# Altium project 24V-7A-Power-Board-v2.0.PrjPcb (part 4 of 5)
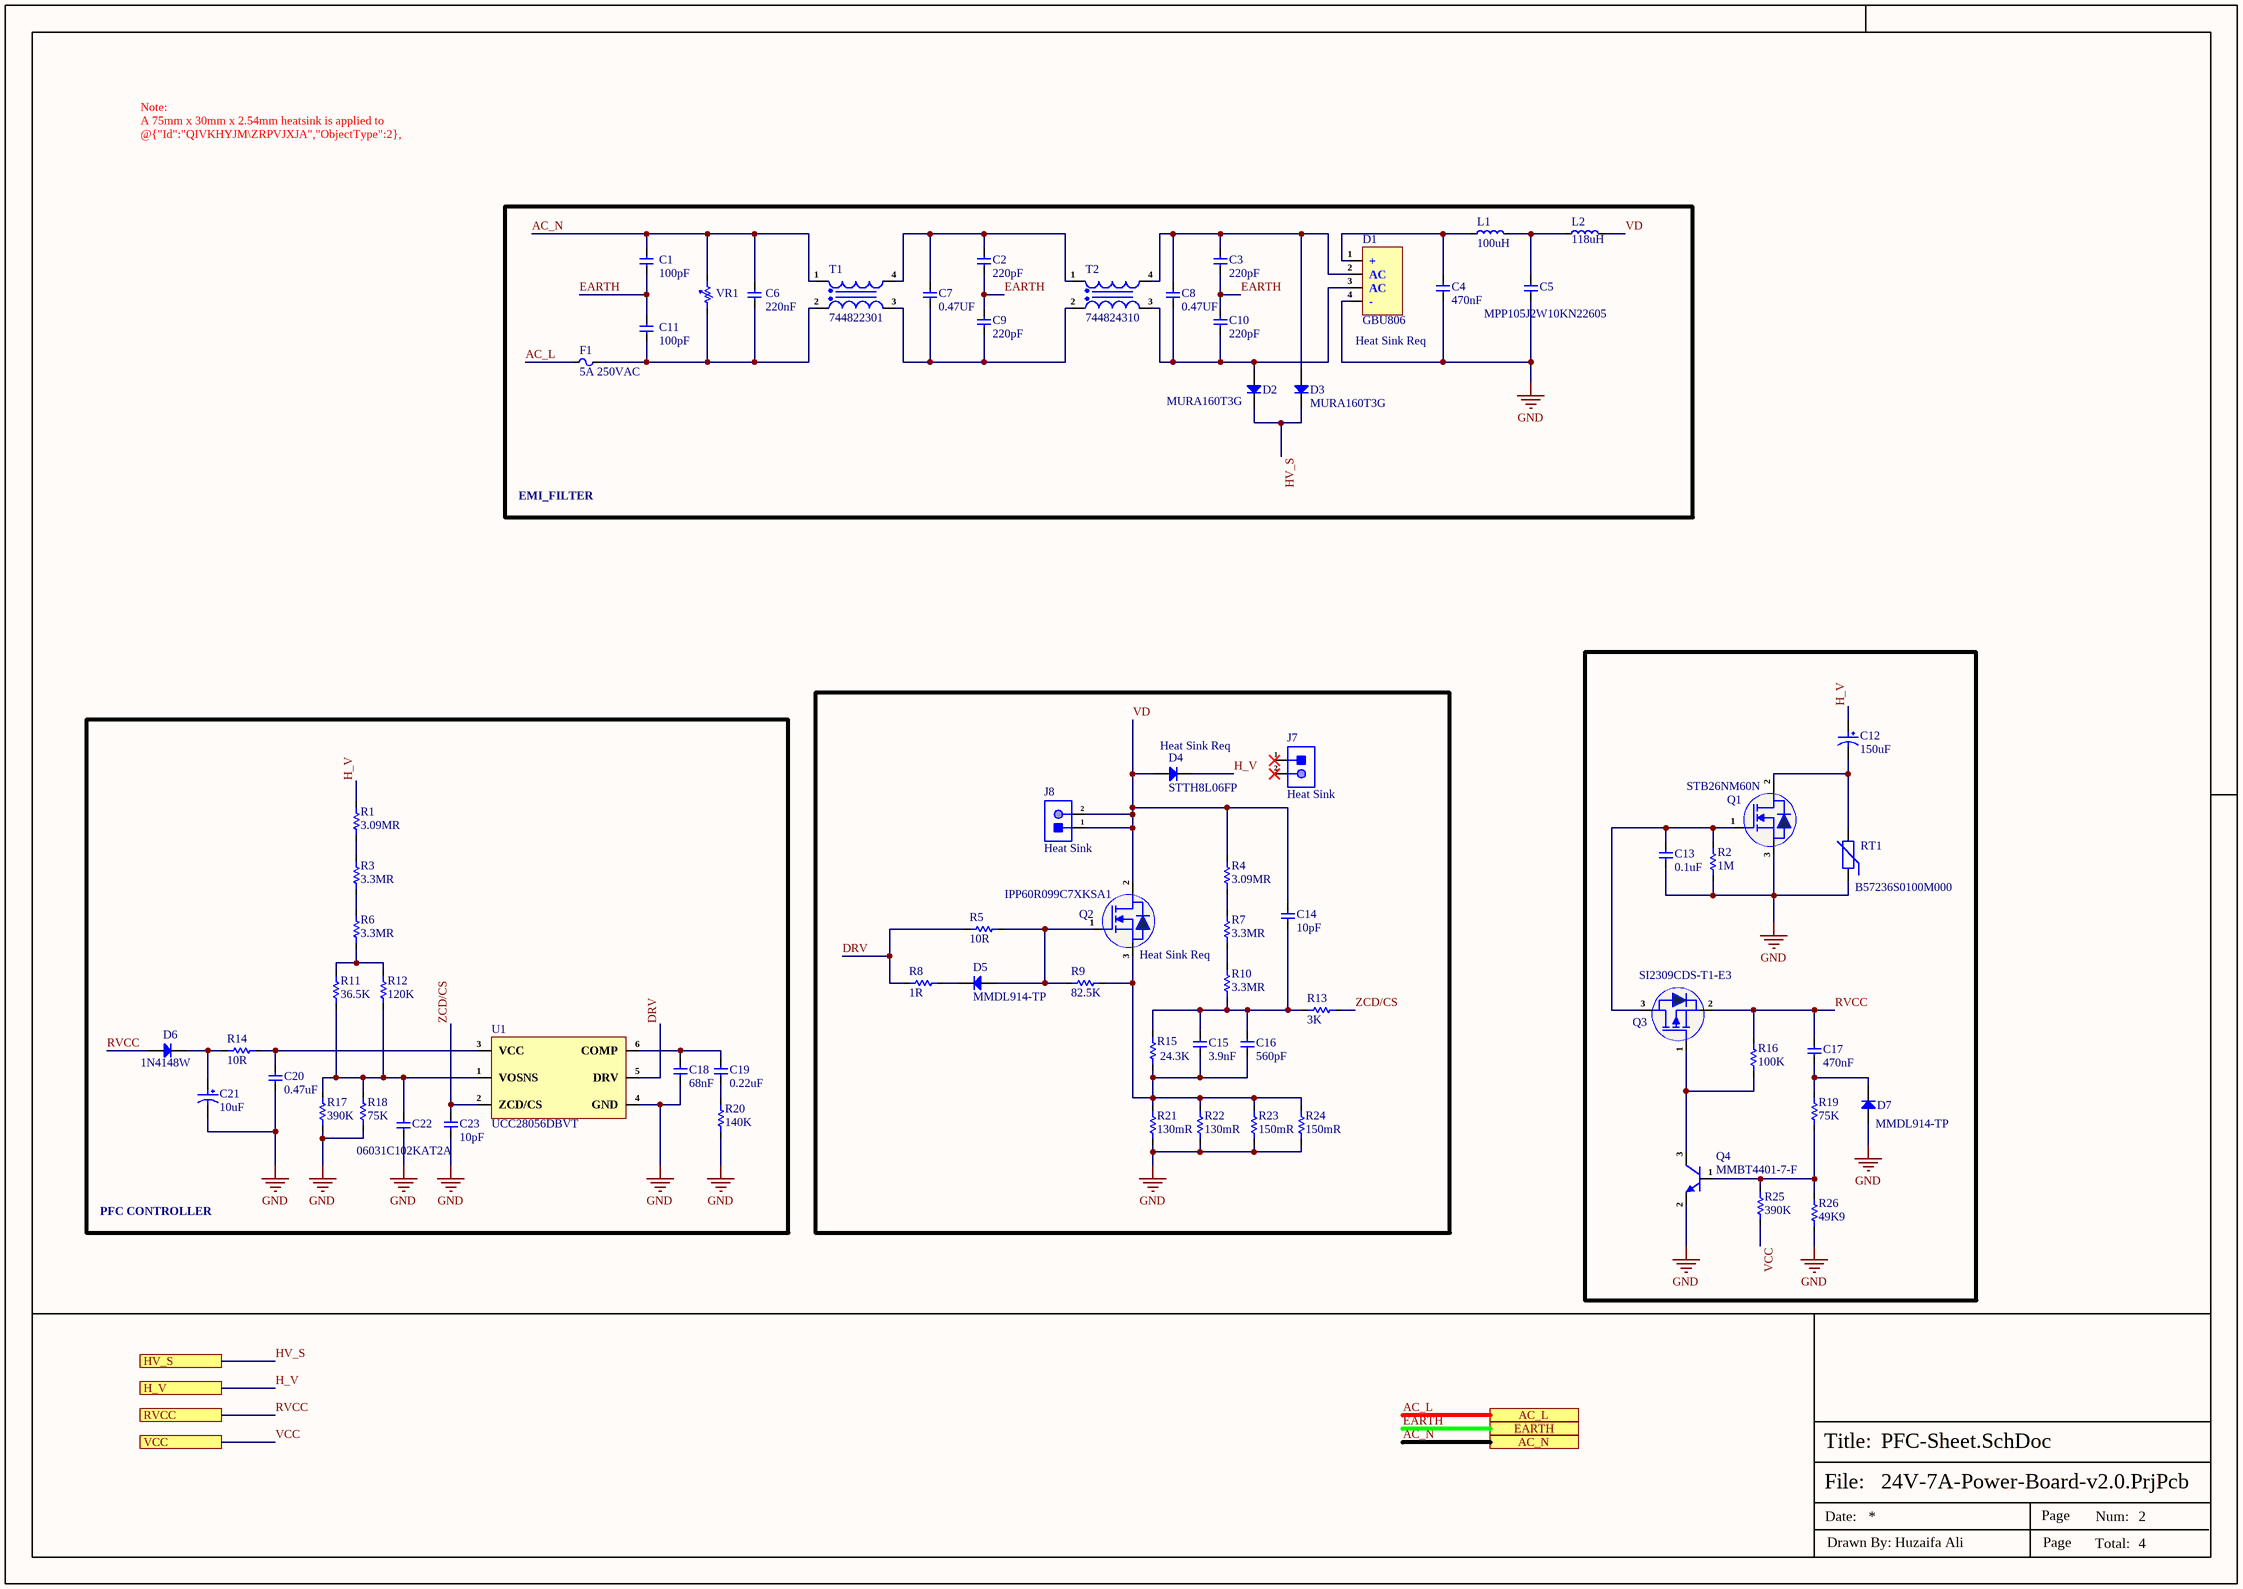
[diagram p6: PFC-Sheet.SchDoc]

## Sheet PFC-Sheet.SchDoc (continued)
### Library data of the parts
C1 C11 = DE1B3RA101KN4AN01F: CAP CER 100PF 250V RADIAL; Manufacturer: Murata; Item Type: Capacitors; Material: 4241ConductorMaterial; Supplier: Mouser; LCSC Part Number: C3285641; Manufacturer Part Number: DE1B3RA101KN4AN01F; RoHS: Yes; Stock: 583; Pricing: 1=0.3, 10=0.147, 50=0.147, 100=0.123, 1000=0.089, 10000=0.061 (USD); Height: 9mm; ComponentLink1URL: https://search.murata.co.jp/Ceramy/image/img/A01X/G101/ENG/DE1_RA_N01F_E.pdf?src-supplier=Digikey; ComponentLink1Description: https://search.murata.co.jp/Ceramy/image/img/A01X/G101/ENG/DE1_RA_N01F_E.pdf?src-supplier=Digikey
C2 C3 C9 C10 = DE1B3RA221KN4AN01F: CAP CER 220PF 250V RADIAL; Manufacturer: Murata; Item Type: Suppression Capacitor; Supplier: Mouser; LCSC Part Number: C1622503; Manufacturer Part Number: DE1B3RA221KN4AN01F; RoHS: Yes; Stock: 985; Pricing: 1=0.35, 10=0.168, 50=0.168, 100=0.141, 1000=0.107, 10000=0.069 (USD); ComponentLink1URL: https://search.murata.co.jp/Ceramy/image/img/A01X/G101/ENG/DE1_RA_N01F_E.pdf?src-supplier=Digikey; ComponentLink1Description: https://search.murata.co.jp/Ceramy/image/img/A01X/G101/ENG/DE1_RA_N01F_E.pdf?src-supplier=Digikey
C4 = 450MPK474J: CAP FILM 0.47UF 5% 450VDC RADIAL; Manufacturer: Rubycon; Item Type: Film Capacitors; Dielectric Material: Polypropylene; Voltage Rating (DC): 450V; Supplier: Digikey; LCSC Part Number: C2798220; Manufacturer Part Number: 450MPK474J; RoHS: Yes; Stock: 4083; Pricing: 1=0.84, 10=0.605, 100=0.4311, 4000=0.26942, 8000=0.25962, 12000=0.25531 (USD); Mounting Technology: Through Hole; Case/Package: Radial; Min Operating Temperature: -40°C; Max Operating Temperature: 105°C; Package Quantity: 1; Value: 470nF; Tolerance: 5%; Packaging: Cut Tape; Termination: PC Pins; Series: MPK; Length: 0.709inch; Width: 0.256inch; Height - Seated (Max): 0.433inch; Lead Pitch: 0.591inch; RoHS Compliant: Yes; ComponentLink1URL: https://datasheet.ciiva.com/6281/e-mpk-6281321.pdf?src-supplier=Digikey; ComponentLink1Description: https://datasheet.ciiva.com/6281/e-mpk-6281321.pdf?src-supplier=Digikey; ComponentLink2URL: https://datasheet.ciiva.com/15021/e-mpk-15021932.pdf?src-supplier=Digikey; ComponentLink2Description: https://datasheet.ciiva.com/15021/e-mpk-15021932.pdf?src-supplier=Digikey
C5 = MPP105J2W10KN22605: 1uF -40℃~+105℃ ±5% 450V Plugin,P=10mm Polypropylene Film Capacitors (CBB) ROHS; Manufacturer: KNSCHA; Supplier: LCSC; LCSC Part Number: C2686214; Manufacturer Part Number: MPP105J2W10KN22605; RoHS: No; Item Type: Capacitor
C6 = X2P2224KN1B0130150080ES0: 220nF ±10% X2 275V Plugin,P=10mm Suppression Capacitors ROHS; Manufacturer: STE; Manufacturer Part Number: X2P2224KN1B0130150080ES0; Package: Plugin,P=10mm; LCSC Part Number: C286022; Item Type: Suppression Capacitor; ComponentLink1Description: LCSC; ComponentLink1URL: https://www.lcsc.com/product-detail/Suppression-Capacitors_STE-Songtian-Elec-X2P2224KN1B0130150080ES0_C286022.html
C7 C8 = 890324024005: CAP FILM 0.47UF 10% 275VAC RAD; Manufacturer: Wurth Electronics; Item Type: Capacitor; Supplier: Digikey; Supplier Part Number: 732-5890-ND; Manufacturer Part Number: 890324024005; RoHS: Yes; Stock: 13537; Pricing: 1=0.75, 50=0.645, 100=0.574, 250=0.501, 500=0.454, 1000=0.418 (USD); ComponentLink1URL: http://www.farnell.com/datasheets/1867975.pdf?src-supplier=Farnell; ComponentLink1Description: http://www.farnell.com/datasheets/1867975.pdf?src-supplier=Farnell; ComponentLink2URL: http://www.farnell.com/datasheets/1867975.pdf?src-supplier=Element14; ComponentLink2Description: http://www.farnell.com/datasheets/1867975.pdf?src-supplier=Element14; ComponentLink3URL: https://katalog.we-online.de/pbs/datasheet/890324024005.pdf?src-supplier=Digikey; ComponentLink3Description: https://katalog.we-online.de/pbs/datasheet/890324024005.pdf?src-supplier=Digikey; ComponentLink4URL: http://www.farnell.com/datasheets/1867975.pdf?src-supplier=Newark; ComponentLink4Description: http://www.farnell.com/datasheets/1867975.pdf?src-supplier=Newark
C12 = KN151M45025*30A: 20% 900mA@120Hz 10mm 450V 150uF Plugin,D25xL30mm Horn-Type Electrolytic Capacitors ROHS; Manufacturer: KFSON; Manufacturer Part Number: KN151M45025*30A; Package: Plugin,D25xL30mm; LCSC Part Number: C513373; Item Type: Capacitor; ComponentLink1Description: LCSC; ComponentLink1URL: https://www.lcsc.com/product-detail/Horn-Type-Electrolytic-Capacitors_KFSON-KN151M45025-30A_C513373.html
C13 = CL10B104KB8WPNC: CAP CER 0.1UF 50V X7R 0603; Item Type: Capacitor; Material: 4241ConductorMaterial; Value: 100nF; Tolerance: 10%; LCSC Part Number: C307348; ComponentLink1Description: LCSC; Supplier: Rs; Supplier Part Number: 2575919; RoHS: Yes; Category: Ceramic Capacitors; Stock: 400; Pricing: 100=0.021, 500=0.019, 1000=0.015, 2000=0.01 (GBP); Mounting Technology: Surface Mount; Case/Package: 0603; Case Code (Metric): 1608; Case Code (Imperial): 0603; Min Operating Temperature: -55°C; Max Operating Temperature: 125°C; Packaging: Cut Tape; Voltage Rating: 50V; Series: CL; Voltage Rating (DC): 50V; Height: 900um; Ratings: AEC-Q200; RoHS Compliant: Yes; Lead Free: 5697LeadFree; ComponentLink2URL: http://www.farnell.com/datasheets/2710560.pdf?src-supplier=Farnell; ComponentLink2Description: http://www.farnell.com/datasheets/2710560.pdf?src-supplier=Farnell; ComponentLink3URL: http://www.samsungsem.com/kr/support/product-search/mlcc/CL10B104KB8WPNC.jsp?src-supplier=Digi-Key; ComponentLink3Description: http://www.samsungsem.com/kr/support/product-search/mlcc/CL10B104KB8WPNC.jsp?src-supplier=Digi-Key; ComponentLink4URL: http://www.farnell.com/datasheets/2710560.pdf?src-supplier=Element14; ComponentLink4Description: http://www.farnell.com/datasheets/2710560.pdf?src-supplier=Element14; ComponentLink5URL: https://datasheet.octopart.com/CL10B104KB8WPNC-Samsung-Electro-Mechanics-datasheet-120093645.pdf?src-supplier=Future+Electronics; ComponentLink5Description: https://datasheet.octopart.com/CL10B104KB8WPNC-Samsung-Electro-Mechanics-datasheet-120093645.pdf?src-supplier=Future+Electronics; ComponentLink6URL: http://www.farnell.com/datasheets/2710560.pdf?src-supplier=Newark; ComponentLink6Description: http://www.farnell.com/datasheets/2710560.pdf?src-supplier=Newark; ComponentLink7URL: http://www.samsungsem.com/servlet/FileDownload?type=spec&file=CL10B104KB8WPNC.pdf&src-supplier=Avnet; ComponentLink7Description: http://www.samsungsem.com/servlet/FileDownload?type=spec&file=CL10B104KB8WPNC.pdf&src-supplier=Avnet; ComponentLink8URL: https://datasheet.octopart.com/CL10B104KB8WPNC-Samsung-datasheet-8326407.pdf?src-supplier=TME; ComponentLink8Description: https://datasheet.octopart.com/CL10B104KB8WPNC-Samsung-datasheet-8326407.pdf?src-supplier=TME
C14 = CC1206JKNPOCBN100: CAP CER 10PF 1KV C0G/NPO 1206; Manufacturer: Yageo; Item Type: Capacitor; Supplier: Future Electronics; LCSC Part Number: C107172; Manufacturer Part Number: CC1206JKNPOCBN100; RoHS: Yes; Stock: 9000; Pricing: 3000=0.0222, 9000=0.0214, 15000=0.021, 60000=0.0201, 90000=0.0194 (USD); ComponentLink1URL: https://datasheet.ciiva.com/11494/hv-11494856.pdf?src-supplier=Avnet; ComponentLink1Description: https://datasheet.ciiva.com/11494/hv-11494856.pdf?src-supplier=Avnet
C15 = CC0603KRX7R8BB392: CAP CER 3900PF 25V X7R 0603; Manufacturer: Yageo; Item Type: Capacitor; Material: 4241ConductorMaterial; Tolerance: 10%; Supplier: Digikey; LCSC Part Number: C519424; Manufacturer Part Number: CC0603KRX7R8BB392; RoHS: Yes; Stock: 46115; Pricing: 1=0.1, 10=0.061, 50=0.035, 100=0.0271, 500=0.02036, 1000=0.016 (USD); Mounting Technology: Surface Mount; Case/Package: 0603; Case Code (Imperial): 0603; Case Code (Metric): 1608; Weight: 7.1E-05oz; Min Operating Temperature: -55°C; Max Operating Temperature: 125°C; Value: 3.9nF; Voltage Rating (DC): 25V; Packaging: Tape and Reel; Dielectric: X7R; Termination: SMD/SMT; Voltage Rating: 25V; Series: CC; Length: 0.063inch; Width: 0.031inch; Height: 900um; Thickness: 0.035inch; Lead Free: Lead Free; Halogen Free: Halogen Free; ComponentLink1URL: https://datasheet.ciiva.com/13207/upy-gphc-x7r-6-3v-to-50v-8-12304-13207771.pdf?src-supplier=Mouser; ComponentLink1Description: https://datasheet.ciiva.com/13207/upy-gphc-x7r-6-3v-to-50v-8-12304-13207771.pdf?src-supplier=Mouser
C16 = 06035A561JAT2A: CAP CER 560PF 50V C0G/NP0 0603; Manufacturer: Kyocera AVX; Item Type: Capacitor; Supplier: Future Electronics; LCSC Part Number: C597173; Manufacturer Part Number: 06035A561JAT2A; RoHS: Yes; Stock: 180000; Pricing: 4000=0.0172, 16000=0.0165, 40000=0.0091, 60000=0.0158, 100000=0.0088, 120000=0.0155, 160000=0.0083, 300000=0.0148 (USD); ComponentLink1URL: https://datasheet.ciiva.com/27051/1032160-27051276.pdf?src-supplier=Jameco; ComponentLink1Description: https://datasheet.ciiva.com/27051/1032160-27051276.pdf?src-supplier=Jameco; ComponentLink2URL: https://datasheet.ciiva.com/16286/ccog-16286446.pdf?src-supplier=Future+Electronics; ComponentLink2Description: https://datasheet.ciiva.com/16286/ccog-16286446.pdf?src-supplier=Future+Electronics; ComponentLink3URL: https://datasheet.ciiva.com/150/ccog-150647.pdf?src-supplier=Digikey; ComponentLink3Description: https://datasheet.ciiva.com/150/ccog-150647.pdf?src-supplier=Digikey; ComponentLink4URL: https://datasheet.ciiva.com/150/ccog-150648.pdf?src-supplier=Digikey; ComponentLink4Description: https://datasheet.ciiva.com/150/ccog-150648.pdf?src-supplier=Digikey; ComponentLink5URL: https://datasheet.ciiva.com/150/ccog-150649.pdf?src-supplier=Digikey; ComponentLink5Description: https://datasheet.ciiva.com/150/ccog-150649.pdf?src-supplier=Digikey; ComponentLink6URL: https://datasheet.ciiva.com/2987/ccog-2987809.pdf?src-supplier=Avnet; ComponentLink6Description: https://datasheet.ciiva.com/2987/ccog-2987809.pdf?src-supplier=Avnet; ComponentLink7URL: https://datasheet.ciiva.com/2987/ccog-2987810.pdf?src-supplier=Avnet; ComponentLink7Description: https://datasheet.ciiva.com/2987/ccog-2987810.pdf?src-supplier=Avnet; ComponentLink8URL: https://datasheet.ciiva.com/5423/ccog-5423589.pdf?src-supplier=Mouser; ComponentLink8Description: https://datasheet.ciiva.com/5423/ccog-5423589.pdf?src-supplier=Mouser; ComponentLink9URL: https://datasheet.ciiva.com/14598/70001039-14598549.pdf?src-supplier=Allied+Electronics; ComponentLink9Description: https://datasheet.ciiva.com/14598/70001039-14598549.pdf?src-supplier=Allied+Electronics; ComponentLink10URL: https://datasheet.ciiva.com/1124/425357-1124836.pdf?src-supplier=Element14; ComponentLink10Description: https://datasheet.ciiva.com/1124/425357-1124836.pdf?src-supplier=Element14; ComponentLink11URL: https://datasheet.ciiva.com/1124/425357-1124837.pdf?src-supplier=Element14; ComponentLink11Description: https://datasheet.ciiva.com/1124/425357-1124837.pdf?src-supplier=Element14
C17 = 12063C474KAT2A: CAP CER 0.47UF 25V X7R 1206; Manufacturer: Kyocera AVX; Item Type: Capacitor; Supplier: Future Electronics; LCSC Part Number: C5128353; Manufacturer Part Number: 12063C474KAT2A; RoHS: Yes; Stock: 38000; Pricing: 2000=0.0614, 6000=0.0591, 10000=0.0566, 20000=0.0567, 40000=0.0554, 80000=0.053 (USD); ComponentLink1URL: https://datasheet.ciiva.com/11788/0900766b80dc2409-11788602.pdf?src-supplier=Rs; ComponentLink1Description: https://datasheet.ciiva.com/11788/0900766b80dc2409-11788602.pdf?src-supplier=Rs; ComponentLink2URL: https://datasheet.ciiva.com/19476/2014158-19476160.pdf?src-supplier=Jameco; ComponentLink2Description: https://datasheet.ciiva.com/19476/2014158-19476160.pdf?src-supplier=Jameco; ComponentLink3URL: https://datasheet.ciiva.com/14601/70001075-14601957.pdf?src-supplier=Allied+Electronics; ComponentLink3Description: https://datasheet.ciiva.com/14601/70001075-14601957.pdf?src-supplier=Allied+Electronics; ComponentLink4URL: https://datasheet.ciiva.com/28546/683218-28546839.pdf?src-supplier=Element14; ComponentLink4Description: https://datasheet.ciiva.com/28546/683218-28546839.pdf?src-supplier=Element14; ComponentLink5URL: https://datasheet.ciiva.com/7833/84526-7833365.pdf?src-supplier=Element14; ComponentLink5Description: https://datasheet.ciiva.com/7833/84526-7833365.pdf?src-supplier=Element14; ComponentLink6URL: https://datasheet.ciiva.com/16291/cx7r-16291039.pdf?src-supplier=Future+Electronics; ComponentLink6Description: https://datasheet.ciiva.com/16291/cx7r-16291039.pdf?src-supplier=Future+Electronics; ComponentLink7URL: https://datasheet.ciiva.com/152/cx7r-152592.pdf?src-supplier=Digikey; ComponentLink7Description: https://datasheet.ciiva.com/152/cx7r-152592.pdf?src-supplier=Digikey; ComponentLink8URL: https://datasheet.ciiva.com/152/cx7r-152593.pdf?src-supplier=Digikey; ComponentLink8Description: https://datasheet.ciiva.com/152/cx7r-152593.pdf?src-supplier=Digikey; ComponentLink9URL: https://datasheet.ciiva.com/152/cx7r-152594.pdf?src-supplier=Digikey; ComponentLink9Description: https://datasheet.ciiva.com/152/cx7r-152594.pdf?src-supplier=Digikey
C18 = CC0603KRX7R9BB683: CAP CER 0.068UF 50V X7R 0603; Manufacturer: Yageo; Item Type: Capacitors; Material: 4241ConductorMaterial; Tolerance: 10%; Supplier: Future Electronics; Supplier Part Number: 3015344; Manufacturer Part Number: CC0603KRX7R9BB683; RoHS: Yes; Stock: 52000; Pricing: 4000=0.0058, 16000=0.0055, 60000=0.0052, 160000=0.005, 400000=0.0047 (USD); Mounting Technology: Surface Mount; Case/Package: 0603; Case Code (Imperial): 0603; Case Code (Metric): 1608; Weight: 7.1E-05oz; Min Operating Temperature: -55°C; Max Operating Temperature: 125°C; Value: 68nF; Voltage Rating (DC): 50V; Packaging: Tape and Reel; Voltage Rating: 50V; Dielectric: X7R; Termination: SMD/SMT; Series: CC; Length: 0.063inch; Width: 0.031inch; Thickness: 0.035inch; Lead Free: Lead Free; Halogen Free: Halogen Free; RoHS Compliant: Yes; ComponentLink1URL: http://www.mouser.com/ds/2/447/Yageo_UPY-GP_NP0_16V-to-50V_9-358835.pdf?src-supplier=Mouser; ComponentLink1Description: http://www.mouser.com/ds/2/447/Yageo_UPY-GP_NP0_16V-to-50V_9-358835.pdf?src-supplier=Mouser; ComponentLink2URL: https://datasheet.octopart.com/CC0603KRX7R9BB683-Yageo-datasheet-166511530.pdf?src-supplier=Future+Electronics; ComponentLink2Description: https://datasheet.octopart.com/CC0603KRX7R9BB683-Yageo-datasheet-166511530.pdf?src-supplier=Future+Electronics; ComponentLink3URL: http://www.yageo.com/documents/recent/UPY-GPHC_X7R_6.3V-to-50V_18.pdf?src-supplier=Digikey; ComponentLink3Description: http://www.yageo.com/documents/recent/UPY-GPHC_X7R_6.3V-to-50V_18.pdf?src-supplier=Digikey; ComponentLink4URL: https://www.yageo.com/upload/media/product/productsearch/datasheet/mlcc/UPY-GPHC_X7R_6.3V-to-50V_18.pdf?src-supplier=Digikey; ComponentLink4Description: https://www.yageo.com/upload/media/product/productsearch/datasheet/mlcc/UPY-GPHC_X7R_6.3V-to-50V_18.pdf?src-supplier=Digikey; ComponentLink5URL: https://datasheet.octopart.com/CC0603KRX7R9BB683-Yageo-datasheet-140260305.pdf?src-supplier=Newark; ComponentLink5Description: https://datasheet.octopart.com/CC0603KRX7R9BB683-Yageo-datasheet-140260305.pdf?src-supplier=Newark; ComponentLink6URL: http://www.yageo.com/documents/recent/UPY-GPHC_X7R_6.3V-to-50V_9.pdf?src-supplier=Future+Electronics; ComponentLink6Description: http://www.yageo.com/documents/recent/UPY-GPHC_X7R_6.3V-to-50V_9.pdf?src-supplier=Future+Electronics; LCSC Part Number: C107098
C19 = CC0603KRX7R7BB224: CAP CER 0.22UF 16V X7R 0603; Manufacturer: Yageo; Item Type: Capacitor; Material: 4241ConductorMaterial; Supplier: Digikey; Supplier Part Number: 311-1426-1-ND; Manufacturer Part Number: CC0603KRX7R7BB224; RoHS: Yes; Stock: 45192; Pricing: 1=0.1, 10=0.058, 50=0.0334, 100=0.0258, 500=0.01944, 1000=0.01528 (USD); Voltage Rating (DC): 16V; Lead Free: 5697LeadFree; Halogen Free: 5694HalogenFree; ComponentLink1URL: https://datasheet.ciiva.com/11788/0900766b80d84f1d-11788400.pdf?src-supplier=Rs; ComponentLink1Description: https://datasheet.ciiva.com/11788/0900766b80d84f1d-11788400.pdf?src-supplier=Rs; ComponentLink2URL: https://datasheet.ciiva.com/176/mlccorderingcode-176606.pdf?src-supplier=Digikey; ComponentLink2Description: https://datasheet.ciiva.com/176/mlccorderingcode-176606.pdf?src-supplier=Digikey; ComponentLink3URL: https://datasheet.ciiva.com/176/mlccorderingcode-176607.pdf?src-supplier=Digikey; ComponentLink3Description: https://datasheet.ciiva.com/176/mlccorderingcode-176607.pdf?src-supplier=Digikey; ComponentLink4URL: https://datasheet.ciiva.com/176/mlccorderingcode-176608.pdf?src-supplier=Digikey; ComponentLink4Description: https://datasheet.ciiva.com/176/mlccorderingcode-176608.pdf?src-supplier=Digikey
C20 = CC1206KKX7R9BB474: CAP CER 0.47UF 50V X7R 1206; Manufacturer: Yageo; Item Type: Capacitor; Material: 4241ConductorMaterial; Supplier: Future Electronics; LCSC Part Number: C277483; Manufacturer Part Number: CC1206KKX7R9BB474; RoHS: Yes; Stock: 36000; Pricing: 3000=0.0393, 9000=0.0378, 15000=0.0371, 30000=0.0362, 60000=0.0349 (USD); ComponentLink1URL: https://datasheet.ciiva.com/13210/upy-gp-np0-16v-to-50v-8-13210236.pdf?src-supplier=Mouser; ComponentLink1Description: https://datasheet.ciiva.com/13210/upy-gp-np0-16v-to-50v-8-13210236.pdf?src-supplier=Mouser; ComponentLink2URL: https://datasheet.ciiva.com/181/mlccorderingcode-181013.pdf?src-supplier=Digikey; ComponentLink2Description: https://datasheet.ciiva.com/181/mlccorderingcode-181013.pdf?src-supplier=Digikey; ComponentLink3URL: https://datasheet.ciiva.com/181/mlccorderingcode-181014.pdf?src-supplier=Digikey; ComponentLink3Description: https://datasheet.ciiva.com/181/mlccorderingcode-181014.pdf?src-supplier=Digikey; ComponentLink4URL: https://datasheet.ciiva.com/181/mlccorderingcode-181015.pdf?src-supplier=Digikey; ComponentLink4Description: https://datasheet.ciiva.com/181/mlccorderingcode-181015.pdf?src-supplier=Digikey
C21 = 50SVPF10M: CAP ALUM POLY 10UF 20% 50V SMD; Manufacturer: Panasonic; Material: 4242ConductorMaterial; Item Type: Capacitor; Supplier: Mouser; Supplier Part Number: 667-50SVPF10M; Manufacturer Part Number: 50SVPF10M; RoHS: Yes; Category: Polymer Capacitors; Stock: 29802; Pricing: 1=1.12, 10=0.801, 50=0.801, 100=0.665, 1000=0.555, 10000=0.504 (USD); ComponentLink1URL: https://datasheet.ciiva.com/48542/svpf-eng-ds-48542427.pdf?src-supplier=Distrelec; ComponentLink1Description: https://datasheet.ciiva.com/48542/svpf-eng-ds-48542427.pdf?src-supplier=Distrelec; ComponentLink2URL: https://datasheet.ciiva.com/24216/svpf-os-262415-24216043.pdf?src-supplier=Mouser; ComponentLink2Description: https://datasheet.ciiva.com/24216/svpf-os-262415-24216043.pdf?src-supplier=Mouser; ComponentLink3URL: https://datasheet.ciiva.com/25761/1734360-25761263.pdf?src-supplier=Farnell; ComponentLink3Description: https://datasheet.ciiva.com/25761/1734360-25761263.pdf?src-supplier=Farnell; LCSC Part Number: C2162323
C22 = 06031C102KAT2A: CAP CER 1000PF 100V X7R 0603; Manufacturer: Kyocera AVX; Item Type: Capacitor; Supplier: Avnet; LCSC Part Number: C2167292; Manufacturer Part Number: 06031C102KAT2A; RoHS: Yes; Stock: 656000; Pricing: 4000=0.0086, 8000=0.0084, 16000=0.0082, 24000=0.008, 32000=0.0079 (USD); Lead Free: 5697LeadFree; ComponentLink1URL: https://datasheet.ciiva.com/5422/cx7r-218113-5422905.pdf?src-supplier=Mouser; ComponentLink1Description: https://datasheet.ciiva.com/5422/cx7r-218113-5422905.pdf?src-supplier=Mouser; ComponentLink2URL: https://datasheet.ciiva.com/11499/cx7r-11499669.pdf?src-supplier=Avnet; ComponentLink2Description: https://datasheet.ciiva.com/11499/cx7r-11499669.pdf?src-supplier=Avnet; ComponentLink3URL: https://datasheet.ciiva.com/2987/cx7r-2987733.pdf?src-supplier=Avnet; ComponentLink3Description: https://datasheet.ciiva.com/2987/cx7r-2987733.pdf?src-supplier=Avnet; ComponentLink4URL: https://datasheet.ciiva.com/150/cx7r-150395.pdf?src-supplier=Digikey; ComponentLink4Description: https://datasheet.ciiva.com/150/cx7r-150395.pdf?src-supplier=Digikey; ComponentLink5URL: https://datasheet.ciiva.com/150/cx7r-150396.pdf?src-supplier=Digikey; ComponentLink5Description: https://datasheet.ciiva.com/150/cx7r-150396.pdf?src-supplier=Digikey; ComponentLink6URL: https://datasheet.ciiva.com/150/cx7r-150397.pdf?src-supplier=Digikey; ComponentLink6Description: https://datasheet.ciiva.com/150/cx7r-150397.pdf?src-supplier=Digikey; ComponentLink7URL: https://datasheet.ciiva.com/1124/1679506-1124198.pdf?src-supplier=Element14; ComponentLink7Description: https://datasheet.ciiva.com/1124/1679506-1124198.pdf?src-supplier=Element14; ComponentLink8URL: https://datasheet.ciiva.com/22693/1679506-22693579.pdf?src-supplier=Element14; ComponentLink8Description: https://datasheet.ciiva.com/22693/1679506-22693579.pdf?src-supplier=Element14; ComponentLink9URL: https://datasheet.ciiva.com/7855/1679506-7855033.pdf?src-supplier=Element14; ComponentLink9Description: https://datasheet.ciiva.com/7855/1679506-7855033.pdf?src-supplier=Element14; ComponentLink10URL: https://datasheet.ciiva.com/7855/84526-7855189.pdf?src-supplier=Element14; ComponentLink10Description: https://datasheet.ciiva.com/7855/84526-7855189.pdf?src-supplier=Element14; ComponentLink11URL: https://datasheet.ciiva.com/16289/cx7r-16289400.pdf?src-supplier=Future+Electronics; ComponentLink11Description: https://datasheet.ciiva.com/16289/cx7r-16289400.pdf?src-supplier=Future+Electronics; ComponentLink12URL: https://datasheet.ciiva.com/14594/70001075-14594623.pdf?src-supplier=Allied+Electronics; ComponentLink12Description: https://datasheet.ciiva.com/14594/70001075-14594623.pdf?src-supplier=Allied+Electronics; ComponentLink13URL: https://datasheet.ciiva.com/14600/70001075-14600988.pdf?src-supplier=Allied+Electronics; ComponentLink13Description: https://datasheet.ciiva.com/14600/70001075-14600988.pdf?src-supplier=Allied+Electronics
C23 = 06035A100JAT2A: CAP CER 10PF 50V C0G/NP0 0603; Manufacturer: Kyocera AVX; Manufacturer Part Number: 06035A100JAT2A/4K; Tolerance: 5%; Dielectric: C0G; Temperature Coefficient: 30ppm/°C; Insulation Resistance: 100GR; Item Type: Capacitor; Supplier 1: Digi-Key; Stock 1: 196463; Pricing 1: 1=0.1, 10=0.05, 50=0.0272, 100=0.0222, 500=0.01586, 1000=0.01246 (USD); Mount: Surface Mount; Case/Package: 0603; Number of Pins: 2; Min Operating Temperature: -55°C; Max Operating Temperature: 125°C; Capacitance: 10pF; Packaging: Cut Tape; Voltage Rating (DC): 50V; Voltage: 50V; Length: 1.6mm; Width: 810um; Height: 0.9mm; Depth: 0.81mm; Thickness: 864um; REACH SVHC: No SVHC; Lead Free: Lead Free; Supplier Part Number 1: 478-1163-1-ND; LCSC Part Number: C79547
D1 = GBU806: BRIDGE RECT 1PHASE 600V 8A GBU; Manufacturer: Diodes; Item Type: Diode; Supplier: Future Electronics; LCSC Part Number: C150753; Manufacturer Part Number: GBU806; RoHS: Yes; Stock: 174414; Pricing: 20=0.565, 100=0.54, 500=0.51, 1000=0.5, 3000=0.465 (USD); ComponentLink1URL: https://datasheet.ciiva.com/27052/1540404-27052400.pdf?src-supplier=Jameco; ComponentLink1Description: https://datasheet.ciiva.com/27052/1540404-27052400.pdf?src-supplier=Jameco; ComponentLink2URL: https://datasheet.ciiva.com/16206/ds21227-16206956.pdf?src-supplier=Future+Electronics; ComponentLink2Description: https://datasheet.ciiva.com/16206/ds21227-16206956.pdf?src-supplier=Future+Electronics; ComponentLink3URL: https://datasheet.ciiva.com/15145/getdatasheetpartid-157294-15145339.pdf?src-supplier=Verical; ComponentLink3Description: https://datasheet.ciiva.com/15145/getdatasheetpartid-157294-15145339.pdf?src-supplier=Verical; ComponentLink4URL: https://datasheet.ciiva.com/885/ds21227-885908.pdf?src-supplier=Digikey; ComponentLink4Description: https://datasheet.ciiva.com/885/ds21227-885908.pdf?src-supplier=Digikey; ComponentLink5URL: https://datasheet.ciiva.com/11195/ds21227-11195657.pdf?src-supplier=Avnet; ComponentLink5Description: https://datasheet.ciiva.com/11195/ds21227-11195657.pdf?src-supplier=Avnet
D2 D3 = MURA160T3G: DIODE GEN PURP 600V 1A SMA; Manufacturer: ON Semiconductor; Forward Current: 2A; Max Reverse Current: 5uA; Max Surge Current: 30A; Forward Voltage: 1.25V; Recovery Time: 75ns; Polarity: Standard; Supplier: Future Electronics; LCSC Part Number: C50432; Manufacturer Part Number: MURA160T3G; RoHS: Yes; Item Type: Diode; Stock: 190000; Pricing: 5000=0.109, 10000=0.106, 15000=0.104, 20000=0.103, 25000=0.0996 (USD); Case/Package: SMA; Pins: 2; Min Operating Temperature: -65°C; Max Operating Temperature: 175°C; Package Quantity: 1; Packaging: Tape and Reel; Average Rectified Current: 2A; Reverse Recovery Time: 75ns; Max Repetitive Reverse Voltage (Vrrm): 600V; Peak Non-Repetitive Surge Current: 30A; Max Forward Surge Current (Ifsm): 30A; Voltage Rating (DC): 600V; Current Rating: 2A; Output Current: 1A; Max Reverse Voltage (DC): 600V; Reverse Voltage: 600V; Series: -; Reverse Recovery Time-Max: 75ns; Length: 4.32mm; Width: 2.6mm; Height: 2mm; Radiation Hardening: No; Reach SVHC Compliant: No; Lead Free: Lead Free; Halogen Free: Halogen Free; RoHS Compliant: Yes; ComponentLink1URL: https://datasheet.ciiva.com/8293/mura160t3-d-8293035.pdf?src-supplier=Avnet; ComponentLink1Description: https://datasheet.ciiva.com/8293/mura160t3-d-8293035.pdf?src-supplier=Avnet; ComponentLink2URL: https://datasheet.ciiva.com/27056/2015775-27056224.pdf?src-supplier=Jameco; ComponentLink2Description: https://datasheet.ciiva.com/27056/2015775-27056224.pdf?src-supplier=Jameco; ComponentLink3URL: https://datasheet.ciiva.com/16395/mura160t3-d-16395990.pdf?src-supplier=Future+Electronics; ComponentLink3Description: https://datasheet.ciiva.com/16395/mura160t3-d-16395990.pdf?src-supplier=Future+Electronics
D4 = STTH8L06FP: DIODE GEN PURP 600V 8A TO220FPAC; Manufacturer: STMicroelectronics; Supplier: Mouser; LCSC Part Number: C77956; Manufacturer Part Number: STTH8L06FP; RoHS: Yes; Item Type: Diode; Stock: 2675; Pricing: 1=0.8, 10=0.793, 50=0.793, 100=0.793, 1000=0.673, 10000=0.377 (USD); ComponentLink1URL: https://datasheet.ciiva.com/4455/cd00002721-110256-4455363.pdf?src-supplier=Mouser; ComponentLink1Description: https://datasheet.ciiva.com/4455/cd00002721-110256-4455363.pdf?src-supplier=Mouser; ComponentLink2URL: https://datasheet.ciiva.com/7964/1522573-7964086.pdf?src-supplier=Element14; ComponentLink2Description: https://datasheet.ciiva.com/7964/1522573-7964086.pdf?src-supplier=Element14; ComponentLink3URL: https://datasheet.ciiva.com/917/cd00002721-917751.pdf?src-supplier=Digikey; ComponentLink3Description: https://datasheet.ciiva.com/917/cd00002721-917751.pdf?src-supplier=Digikey; ComponentLink4URL: https://datasheet.ciiva.com/14169/cd00002721-14169005.pdf?src-supplier=Distrelec; ComponentLink4Description: https://datasheet.ciiva.com/14169/cd00002721-14169005.pdf?src-supplier=Distrelec
D5 D7 = MMDL914-TP: 100V 1V@10mA 4ns 200mA SOD-323 Switching Diodes ROHS; Manufacturer: MCC; Item Type: Diode; Supplier: Digikey; LCSC Part Number: C668970; Manufacturer Part Number: MMDL914-TP; RoHS: Yes; Stock: 172971; Pricing: 1=0.15, 10=0.108, 100=0.0585, 500=0.04594, 1000=0.03191 (USD); ComponentLink1URL: https://datasheet.ciiva.com/6367/mmdl914sod-323-6367364.pdf?src-supplier=Digikey; ComponentLink1Description: https://datasheet.ciiva.com/6367/mmdl914sod-323-6367364.pdf?src-supplier=Digikey; ComponentLink2URL: https://datasheet.ciiva.com/24097/mmdl914sod-323-24097719.pdf?src-supplier=Mouser; ComponentLink2Description: https://datasheet.ciiva.com/24097/mmdl914sod-323-24097719.pdf?src-supplier=Mouser; ComponentLink3URL: https://datasheet.ciiva.com/6367/mmdl914sod-323-6367366.pdf?src-supplier=Digikey; ComponentLink3Description: https://datasheet.ciiva.com/6367/mmdl914sod-323-6367366.pdf?src-supplier=Digikey; ComponentLink4URL: https://datasheet.ciiva.com/6367/mmdl914sod-323-6367368.pdf?src-supplier=Digikey; ComponentLink4Description: https://datasheet.ciiva.com/6367/mmdl914sod-323-6367368.pdf?src-supplier=Digikey
D6 = 1N4148W: 100V 400mW Single 1.25V@150mA 8ns 300mA SOD-123 Switching Diode ROHS; Manufacturer: JSMSEMI; ComponentLink1Description: LCSC; ComponentLink1URL: https://www.lcsc.com/product-detail/Switching-Diode_JSMSEMI-1N4148W_C917030.html; Manufacturer Part Number: 1N4148W; Package: SOD-123; LCSC Part Number: C917030; Item Type: Diode
F1 = 37215000001: FUSE BOARD MNT 5A 250VAC RADIAL; Manufacturer: Littelfuse Wickmann; Item Type: Fuses; Supplier: Digikey; LCSC Part Number: C142820; Manufacturer Part Number: 37215000001; RoHS: Yes; Stock: 2122; Pricing: 1=0.96, 5=0.928, 10=0.869, 50=0.7192, 100=0.5993, 250=0.58436, 500=0.49446 (USD); ComponentLink1URL: https://datasheet.ciiva.com/299/littelfuse-fuse-372-299190.pdf?src-supplier=Digikey; ComponentLink1Description: https://datasheet.ciiva.com/299/littelfuse-fuse-372-299190.pdf?src-supplier=Digikey; ComponentLink2URL: https://datasheet.ciiva.com/16298/littelfuse-fuse-372-16298798.pdf?src-supplier=Future+Electronics; ComponentLink2Description: https://datasheet.ciiva.com/16298/littelfuse-fuse-372-16298798.pdf?src-supplier=Future+Electronics
J7 J8 = 35*12*25: 35*12*25MM 6063-T5 aluminum Heat sink/heatsink ROHS; Manufacturer: XSD; Manufacturer Part Number: 35*12*25; LCSC Part Number: C4663; Item Type: Heat sink; ComponentLink1Description: LCSC; ComponentLink1URL: https://www.lcsc.com/product-detail/Heat-sink-heatsink_XSD-35-12-25_C4663.html
L1 = 7447021: FIXED IND 100UH 2A 80 MOHM TH; Manufacturer: Wurth Electronics; Item Type: Inductors; Supplier: Mouser; Supplier Part Number: 710-7447021; Manufacturer Part Number: 7447021; RoHS: Yes; Stock: 1392; Pricing: 1=1.93, 10=1.83, 50=1.71, 100=1.61, 1000=1.46, 10000=1.46 (USD); ComponentLink1URL: https://datasheet.ciiva.com/11796/0900766b804e2e89-11796539.pdf?src-supplier=Rs; ComponentLink1Description: https://datasheet.ciiva.com/11796/0900766b804e2e89-11796539.pdf?src-supplier=Rs; ComponentLink2URL: https://datasheet.ciiva.com/6693/7447021-6693538.pdf?src-supplier=Digikey; ComponentLink2Description: https://datasheet.ciiva.com/6693/7447021-6693538.pdf?src-supplier=Digikey; ComponentLink3URL: https://datasheet.ciiva.com/14101/pk7447021-data-de-14101850.pdf?src-supplier=Distrelec; ComponentLink3Description: https://datasheet.ciiva.com/14101/pk7447021-data-de-14101850.pdf?src-supplier=Distrelec; ComponentLink4URL: https://datasheet.ciiva.com/7695/7447021-7695676.pdf?src-supplier=Element14; ComponentLink4Description: https://datasheet.ciiva.com/7695/7447021-7695676.pdf?src-supplier=Element14; ComponentLink5URL: https://datasheet.ciiva.com/48691/001087627-da-01-ml-we-fi-funkentstoerdrossel-7447021-de-en-48691575.pdf?src-supplier=Conrad; ComponentLink5Description: https://datasheet.ciiva.com/48691/001087627-da-01-ml-we-fi-funkentstoerdrossel-7447021-de-en-48691575.pdf?src-supplier=Conrad
L2 = 760801401: FIXED IND 118UH 13.9A 0.022OHM; Manufacturer: Wurth Electronics; Item Type: Inductors; Supplier: Digikey; Supplier Part Number: 732-760801401-ND; Manufacturer Part Number: 760801401; RoHS: No; Stock: 36; Pricing: 1=18.9, 5=17.01, 10=15.12, 20=14.175, 100=13.2301 (USD)
Q1 = STB26NM60N: MOSFET N-CH 600V 20A D2PAK; Manufacturer: STMicroelectronics; Item Type: MOSFETs; Supplier: Mouser; LCSC Part Number: C2688646; Manufacturer Part Number: STB26NM60N; RoHS: Yes; Stock: 642; Pricing: 1=5.74, 10=3.91, 50=3.91, 100=3.5, 1000=3.49, 10000=3.49 (USD); ComponentLink1URL: https://datasheet.ciiva.com/25625/0900766b810ea17c-25625320.pdf?src-supplier=Rs; ComponentLink1Description: https://datasheet.ciiva.com/25625/0900766b810ea17c-25625320.pdf?src-supplier=Rs; ComponentLink2URL: https://datasheet.ciiva.com/6368/cd00232934-6368742.pdf?src-supplier=Digikey; ComponentLink2Description: https://datasheet.ciiva.com/6368/cd00232934-6368742.pdf?src-supplier=Digikey; ComponentLink3URL: https://datasheet.ciiva.com/6368/cd00232934-6368743.pdf?src-supplier=Digikey; ComponentLink3Description: https://datasheet.ciiva.com/6368/cd00232934-6368743.pdf?src-supplier=Digikey; ComponentLink4URL: https://datasheet.ciiva.com/940/cd00232934-940186.pdf?src-supplier=Digikey; ComponentLink4Description: https://datasheet.ciiva.com/940/cd00232934-940186.pdf?src-supplier=Digikey; ComponentLink5URL: https://datasheet.ciiva.com/16490/cd00232934-16490237.pdf?src-supplier=Future+Electronics; ComponentLink5Description: https://datasheet.ciiva.com/16490/cd00232934-16490237.pdf?src-supplier=Future+Electronics
Q2 = IPP60R099C7XKSA1: MOSFET N-CH 600V 22A TO220-3; Manufacturer: Infineon; Item Type: MOSFETs; Supplier: Mouser; LCSC Part Number: C537192; Manufacturer Part Number: IPP60R099C7XKSA1; RoHS: Yes; Stock: 617; Pricing: 1=5.39, 10=4.84, 50=4.78, 100=4.69, 1000=2.27, 10000=2.27 (USD); ComponentLink1URL: http://www.mouser.com/ds/2/196/Infineon-IPP60R099C7-DS-v02_00-EN-1076845.pdf?src-supplier=Mouser; ComponentLink1Description: http://www.mouser.com/ds/2/196/Infineon-IPP60R099C7-DS-v02_00-EN-1076845.pdf?src-supplier=Mouser; ComponentLink2URL: https://www.infineon.com/dgdl/Infineon-IPP60R099C7-DS-v02_00-EN.pdf?fileId=5546d4624cb7f111014d481216877004&src-supplier=Digikey; ComponentLink2Description: https://www.infineon.com/dgdl/Infineon-IPP60R099C7-DS-v02_00-EN.pdf?fileId=5546d4624cb7f111014d481216877004&src-supplier=Digikey
Q3 = SI2309CDS-T1-E3: MOSFET P-CH 60V 1.6A SOT23-3; Manufacturer: Vishay Siliconix; Item Type: MOSFETs; Rise Time: 35ns; Rds On Max: 345mR; Input Capacitance: 210pF; Continuous Drain Current (ID): 1.2A; Max Power Dissipation: 1.7W; Gate to Source Voltage (Vgs): 20V; Turn-Off Delay Time: 15ns; Turn-On Delay Time: 40ns; Number of Channels: 1; Polarity: P-CHANNEL; Power Dissipation: 1W; Threshold Voltage: -1V; Supplier: Mouser; LCSC Part Number: C553975; Manufacturer Part Number: SI2309CDS-T1-E3; RoHS: Yes; Stock: 57582; Pricing: 1=0.53, 10=0.453, 50=0.453, 100=0.316, 1000=0.2, 10000=0.157 (USD); Mounting Technology: Surface Mount; Case/Package: SOT-23-3; Pins: 3; Weight: 0.050717oz; Min Operating Temperature: -55°C; Max Operating Temperature: 150°C; Packaging: Tape and Reel; Package Quantity: 3000; Drain to Source Voltage (Vdss): 60V; Drain to Source Resistance: 345mR; Fall Time: 35ns; Series: TrenchFET®; Drain-source On Resistance-Max: 345mR; Length: 3.04mm; Width: 1.4mm; Height: 1.02mm; Radiation Hardening: No; Lead Free: Lead Free; RoHS Compliant: Yes; ComponentLink1URL: https://datasheet.ciiva.com/16217/si2309cd-16217597.pdf?src-supplier=Future+Electronics; ComponentLink1Description: https://datasheet.ciiva.com/16217/si2309cd-16217597.pdf?src-supplier=Future+Electronics; ComponentLink2URL: https://datasheet.ciiva.com/29742/si2309cd-29742879.pdf?src-supplier=Digikey; ComponentLink2Description: https://datasheet.ciiva.com/29742/si2309cd-29742879.pdf?src-supplier=Digikey
Q4 = MMBT4401-7-F: TRANS NPN 40V 0.6A SOT23-3; Manufacturer: Diodes; Item Type: BJTs; Supplier: Future Electronics; LCSC Part Number: C151826; Manufacturer Part Number: MMBT4401-7-F; RoHS: Yes; Stock: 1359000; Pricing: 3000=0.0119, 12000=0.0113, 30000=0.011, 75000=0.0107, 120000=0.0102 (USD); ComponentLink1URL: https://datasheet.ciiva.com/15139/getdatasheetpartid-91436-15139165.pdf?src-supplier=Verical; ComponentLink1Description: https://datasheet.ciiva.com/15139/getdatasheetpartid-91436-15139165.pdf?src-supplier=Verical; ComponentLink2URL: https://datasheet.ciiva.com/972/ds30039-972547.pdf?src-supplier=Digikey; ComponentLink2Description: https://datasheet.ciiva.com/972/ds30039-972547.pdf?src-supplier=Digikey; ComponentLink3URL: https://datasheet.ciiva.com/972/ds30039-972548.pdf?src-supplier=Digikey; ComponentLink3Description: https://datasheet.ciiva.com/972/ds30039-972548.pdf?src-supplier=Digikey; ComponentLink4URL: https://datasheet.ciiva.com/972/ds30039-972549.pdf?src-supplier=Digikey; ComponentLink4Description: https://datasheet.ciiva.com/972/ds30039-972549.pdf?src-supplier=Digikey; ComponentLink5URL: https://datasheet.ciiva.com/11201/ds30039-11201820.pdf?src-supplier=Avnet; ComponentLink5Description: https://datasheet.ciiva.com/11201/ds30039-11201820.pdf?src-supplier=Avnet; ComponentLink6URL: https://datasheet.ciiva.com/16199/ds30039-16199054.pdf?src-supplier=Future+Electronics; ComponentLink6Description: https://datasheet.ciiva.com/16199/ds30039-16199054.pdf?src-supplier=Future+Electronics
R1 R4 = RC1206FR-073M09L: RES 3.09M OHM 1% 1/4W 1206; Manufacturer: Yageo; Item Type: Resistor; Temperature Coefficient: 100ppm/°C; Max Power Dissipation: 250mW; Voltage Rating (DC): 200V; Supplier: Mouser; LCSC Part Number: C488771; Manufacturer Part Number: RC1206FR-073M09L; RoHS: Yes; Stock: 10394; Pricing: 1=0.1, 10=0.025, 50=0.025, 100=0.015, 1000=0.013, 10000=0.01 (USD); Case/Package: 1206; Contact Plating: Tin,Matte; Case Code (Metric): 3216; Case Code (Imperial): 1206; Min Operating Temperature: -55°C; Max Operating Temperature: 155°C; Value: 3.09MR; Tolerance: 1%; Package Quantity: 1; Packaging: Cut Tape; Number of Terminations: 2; Features: Moisture Resistant; Series: RC; Length: 0.122inch; Width: 0.063inch; Height: 0.026inch; Lead Free: Lead Free; RoHS Compliant: Yes; ComponentLink1URL: https://datasheet.ciiva.com/2461/pyu-rc1206-51-rohs-l-4-2461290.pdf?src-supplier=Digikey; ComponentLink1Description: https://datasheet.ciiva.com/2461/pyu-rc1206-51-rohs-l-4-2461290.pdf?src-supplier=Digikey; ComponentLink2URL: https://datasheet.ciiva.com/2461/pyu-rc1206-51-rohs-l-4-2461291.pdf?src-supplier=Digikey; ComponentLink2Description: https://datasheet.ciiva.com/2461/pyu-rc1206-51-rohs-l-4-2461291.pdf?src-supplier=Digikey; ComponentLink3URL: https://datasheet.ciiva.com/2461/pyu-rc1206-51-rohs-l-4-2461292.pdf?src-supplier=Digikey; ComponentLink3Description: https://datasheet.ciiva.com/2461/pyu-rc1206-51-rohs-l-4-2461292.pdf?src-supplier=Digikey
R2 = RC0805FR-071ML: RES 1M OHM 1% 1/8W 0805; Manufacturer: Yageo; Value: 1MR; Power Rating: 125mW; Temperature Coefficient: 250ppm/°C; Voltage Rating: 150V; Item Type: Resistor; Supplier: Future Electronics; Supplier Part Number: 7283393; Manufacturer Part Number: RC0805FR-071ML; RoHS: Yes; Category: Chip SMD Resistors; Stock: 2655000; Pricing: 5000=0.0027, 25000=0.0025, 125000=0.0024, 500000=0.0023, 1250000=0.0021 (USD); Case/Package: Molded; Case Code (Metric): 2012; Case Code (Imperial): 0805; Min Operating Temperature: -55°C; Max Operating Temperature: 155°C; Resistor Type: Thick Film; Tolerance: 1%; Packaging: Tape and Reel; Construction: Rectangular; Resistance Tolerance: 1%; Voltage Rating (AC): 150V; Length: 2mm; Depth: 1.25mm; Lead Free: Lead Free; RoHS Compliant: Yes; Reach SVHC Compliant: Unknown; Military Standard: Not; LCSC Part Number: C107700
R3 R6 R7 R10 = RC1206FR-073M3L: RES 3.3M OHM 1% 1/4W 1206; Manufacturer: Yageo; Item Type: Resistor; Voltage Rating (AC): 200V; Supplier: Future Electronics; LCSC Part Number: C137288; Manufacturer Part Number: RC1206FR-073M3L; RoHS: Yes; Stock: 130000; Pricing: 5000=0.0038, 20000=0.0036, 75000=0.0034, 200000=0.0032, 500000=0.003 (USD); ComponentLink1URL: https://datasheet.ciiva.com/11809/0900766b80c6630a-11809505.pdf?src-supplier=Rs; ComponentLink1Description: https://datasheet.ciiva.com/11809/0900766b80c6630a-11809505.pdf?src-supplier=Rs; ComponentLink2URL: https://datasheet.ciiva.com/2511/pyu-rc1206-51-rohs-l-4-2511094.pdf?src-supplier=Digikey; ComponentLink2Description: https://datasheet.ciiva.com/2511/pyu-rc1206-51-rohs-l-4-2511094.pdf?src-supplier=Digikey; ComponentLink3URL: https://datasheet.ciiva.com/2511/pyu-rc1206-51-rohs-l-4-2511095.pdf?src-supplier=Digikey; ComponentLink3Description: https://datasheet.ciiva.com/2511/pyu-rc1206-51-rohs-l-4-2511095.pdf?src-supplier=Digikey; ComponentLink4URL: https://datasheet.ciiva.com/2511/pyu-rc1206-51-rohs-l-4-2511096.pdf?src-supplier=Digikey; ComponentLink4Description: https://datasheet.ciiva.com/2511/pyu-rc1206-51-rohs-l-4-2511096.pdf?src-supplier=Digikey; ComponentLink5URL: https://datasheet.ciiva.com/17420/pyu-rc1206-51-rohs-l-4-17420140.pdf?src-supplier=Future+Electronics; ComponentLink5Description: https://datasheet.ciiva.com/17420/pyu-rc1206-51-rohs-l-4-17420140.pdf?src-supplier=Future+Electronics
R5 = CRCW060310R0FKEA: RES SMD 10 OHM 1% 1/10W 0603; Manufacturer: Vishay; Item Type: Resistors; Power Rating: 100mW; Voltage Rating: 75V; Temperature Coefficient: 100ppm/°C; Supplier: Mouser; LCSC Part Number: C844919; Manufacturer Part Number: CRCW060310R0FKEA; RoHS: Yes; Stock: 648208; Pricing: 1=0.1, 10=0.017, 50=0.017, 100=0.01, 1000=0.008, 10000=0.005 (USD); Case/Package: 0603; Pins: 2; Weight: 7.1E-05oz; Case Code (Metric): 1608; Case Code (Imperial): 0603; Contact Plating: Tin; Min Operating Temperature: -55°C; Max Operating Temperature: 155°C; Value: 10R; Tolerance: 1%; Resistor Type: Thick Film; Packaging: Tape and Reel; Package Quantity: 10; Number of Terminations: 2; Termination: SMD/SMT; Max Power Dissipation: 100mW; Features: Automotive AEC-Q200; Series: CRCW; Resistance Tolerance: 1%; Technology: THICK FILM; Voltage Rating (DC): 75V; Construction: Rectangular; Length: 1.55mm; Width: 0.033inch; Height: 0.45mm; Depth: 0.85mm; RoHS Compliant: Yes; Reach SVHC Compliant: Unknown; Lead Free: 5697LeadFree; Military Standard: Not; ComponentLink1URL: https://datasheet.ciiva.com/11808/0900766b80d98afc-11808660.pdf?src-supplier=Rs; ComponentLink1Description: https://datasheet.ciiva.com/11808/0900766b80d98afc-11808660.pdf?src-supplier=Rs; ComponentLink2URL: https://datasheet.ciiva.com/26316/fld-crcw-e3-data-en-26316582.pdf?src-supplier=Distrelec; ComponentLink2Description: https://datasheet.ciiva.com/26316/fld-crcw-e3-data-en-26316582.pdf?src-supplier=Distrelec; ComponentLink3URL: https://datasheet.ciiva.com/2465/dcrcwe3-2465700.pdf?src-supplier=Digikey; ComponentLink3Description: https://datasheet.ciiva.com/2465/dcrcwe3-2465700.pdf?src-supplier=Digikey; ComponentLink4URL: https://datasheet.ciiva.com/16781/70201119-16781847.pdf?src-supplier=Allied+Electronics; ComponentLink4Description: https://datasheet.ciiva.com/16781/70201119-16781847.pdf?src-supplier=Allied+Electronics; ComponentLink5URL: https://datasheet.ciiva.com/22673/1697337-22673071.pdf?src-supplier=Element14; ComponentLink5Description: https://datasheet.ciiva.com/22673/1697337-22673071.pdf?src-supplier=Element14; ComponentLink6URL: https://datasheet.ciiva.com/2465/dcrcwe3-2465701.pdf?src-supplier=Digikey; ComponentLink6Description: https://datasheet.ciiva.com/2465/dcrcwe3-2465701.pdf?src-supplier=Digikey; ComponentLink7URL: https://datasheet.ciiva.com/2465/dcrcwe3-2465699.pdf?src-supplier=Digikey; ComponentLink7Description: https://datasheet.ciiva.com/2465/dcrcwe3-2465699.pdf?src-supplier=Digikey; ComponentLink8URL: https://datasheet.ciiva.com/5547/dcrcwe3-109170-5547342.pdf?src-supplier=Mouser; ComponentLink8Description: https://datasheet.ciiva.com/5547/dcrcwe3-109170-5547342.pdf?src-supplier=Mouser
R8 = CRCW06031R00FKEA: RES SMD 1 OHM 1% 1/10W 0603; Manufacturer: Vishay Dale; Item Type: Resistor; Power Rating: 100mW; Voltage Rating: 75V; Temperature Coefficient: 100ppm/°C; Supplier: Mouser; LCSC Part Number: C844752; Manufacturer Part Number: CRCW06031R00FKEA; RoHS: Yes; Stock: 303523; Pricing: 1=0.1, 10=0.024, 50=0.024, 100=0.014, 1000=0.011, 10000=0.006 (USD); Case/Package: 0603; Pins: 2; Contact Plating: Tin; Weight: 7.1E-05oz; Case Code (Metric): 1608; Case Code (Imperial): 0603; Min Operating Temperature: -55°C; Max Operating Temperature: 155°C; Value: 1R; Tolerance: 1%; Resistor Type: Thick Film; Termination: SMD/SMT; Voltage Rating (DC): 75V; Packaging: Tape and Reel; Number of Terminations: 2; Max Power Dissipation: 100mW; Features: Automotive AEC-Q200; Series: CRCW; Construction: Rectangular; Resistance Tolerance: 1%; Package Quantity: 5000; Length: 1.55mm; Width: 0.85mm; Height: 0.45mm; Depth: 0.85mm; Ratings: AEC-Q200; Radiation Hardening: No; Lead Free: 5697LeadFree; RoHS Compliant: Yes; Military Standard: Not; Reach SVHC Compliant: Unknown; ComponentLink1URL: https://datasheet.ciiva.com/7792/1359337-7792119.pdf?src-supplier=Element14; ComponentLink1Description: https://datasheet.ciiva.com/7792/1359337-7792119.pdf?src-supplier=Element14; ComponentLink2URL: https://datasheet.ciiva.com/3257/dcrcwe3-3257225.pdf?src-supplier=Avnet; ComponentLink2Description: https://datasheet.ciiva.com/3257/dcrcwe3-3257225.pdf?src-supplier=Avnet; ComponentLink3URL: https://datasheet.ciiva.com/2465/dcrcwe3-2465530.pdf?src-supplier=Digikey; ComponentLink3Description: https://datasheet.ciiva.com/2465/dcrcwe3-2465530.pdf?src-supplier=Digikey; ComponentLink4URL: https://datasheet.ciiva.com/2465/dcrcwe3-2465528.pdf?src-supplier=Digikey; ComponentLink4Description: https://datasheet.ciiva.com/2465/dcrcwe3-2465528.pdf?src-supplier=Digikey; ComponentLink5URL: https://datasheet.ciiva.com/5541/dcrcwe3-109170-5541726.pdf?src-supplier=Mouser; ComponentLink5Description: https://datasheet.ciiva.com/5541/dcrcwe3-109170-5541726.pdf?src-supplier=Mouser
R9 = RC0603FR-0782K5L: RES 82.5K OHM 1% 1/10W 0603; Manufacturer: Yageo; Item Type: Resistor; Voltage Rating (DC): 50V; Supplier: Avnet; LCSC Part Number: C185310; Manufacturer Part Number: RC0603FR-0782K5L; RoHS: Yes; Stock: 165000; Pricing: 5000=0.00112 (USD); Lead Free: 5697LeadFree; ComponentLink1URL: https://datasheet.ciiva.com/2519/pyu-r-int-thick-7-2519111.pdf?src-supplier=Digikey; ComponentLink1Description: https://datasheet.ciiva.com/2519/pyu-r-int-thick-7-2519111.pdf?src-supplier=Digikey; ComponentLink2URL: https://datasheet.ciiva.com/2519/pyu-r-int-thick-7-2519112.pdf?src-supplier=Digikey; ComponentLink2Description: https://datasheet.ciiva.com/2519/pyu-r-int-thick-7-2519112.pdf?src-supplier=Digikey; ComponentLink3URL: https://datasheet.ciiva.com/2519/pyu-r-int-thick-7-2519113.pdf?src-supplier=Digikey; ComponentLink3Description: https://datasheet.ciiva.com/2519/pyu-r-int-thick-7-2519113.pdf?src-supplier=Digikey
R11 = RC0603FR-0736K5L: RES 36.5K OHM 1% 1/10W 0603; Manufacturer: YAGEO; Item Type: Resistor; Manufacturer Part Number: RC0603FR-0736K5L; Package: 0603; LCSC Part Number: C137738; ComponentLink1Description: LCSC; ComponentLink1URL: https://www.lcsc.com/product-detail/Chip-Resistor-Surface-Mount_YAGEO-RC0603FR-0736K5L_C137738.html
R12 = RC0603FR-07120KL: RES 120K OHM 1% 1/10W 0603; Manufacturer: Yageo; Item Type: Resistors; Value: 120kR; Power Rating: 100mW; Voltage Rating: 50V; Temperature Coefficient: 100ppm/°C; Working Voltage: 75V; Supplier: Future Electronics; LCSC Part Number: C114607; Manufacturer Part Number: RC0603FR-07120KL; RoHS: Yes; Stock: 3405000; Pricing: 5000=0.0022, 50000=0.0021, 150000=0.0021, 375000=0.002, 1000000=0.0019 (USD); Case/Package: 0603; Pins: 2; Case Code (Metric): 1608; Case Code (Imperial): 0603; Min Operating Temperature: -55°C; Max Operating Temperature: 155°C; Tolerance: 1%; Resistor Type: Thick Film; Voltage Rating (DC): 50V; Package Quantity: 5000; Packaging: Tape and Reel; Number of Terminations: 2; Termination: SMD/SMT; Max Power Dissipation: 100mW; Features: Moisture Resistant; Series: RC; Resistance Tolerance: 1%; Technology: THICK FILM; Voltage Rating (AC): 50V; Length: 0.063inch; Width: 0.031inch; Height: 0.022inch; Depth: 0.8mm; Lead Pitch: 2.54mm; Radiation Hardening: 5898YesNo; RoHS Compliant: Yes; Reach SVHC Compliant: Unknown; Lead Free: 5697LeadFree; ComponentLink1URL: https://datasheet.ciiva.com/11808/0900766b80f96399-11808757.pdf?src-supplier=Rs; ComponentLink1Description: https://datasheet.ciiva.com/11808/0900766b80f96399-11808757.pdf?src-supplier=Rs; ComponentLink2URL: https://datasheet.ciiva.com/2454/pyu-r-int-thick-7-2454739.pdf?src-supplier=Digikey; ComponentLink2Description: https://datasheet.ciiva.com/2454/pyu-r-int-thick-7-2454739.pdf?src-supplier=Digikey; ComponentLink3URL: https://datasheet.ciiva.com/2454/pyu-r-int-thick-7-2454740.pdf?src-supplier=Digikey; ComponentLink3Description: https://datasheet.ciiva.com/2454/pyu-r-int-thick-7-2454740.pdf?src-supplier=Digikey; ComponentLink4URL: https://datasheet.ciiva.com/2454/pyu-r-int-thick-7-2454738.pdf?src-supplier=Digikey; ComponentLink4Description: https://datasheet.ciiva.com/2454/pyu-r-int-thick-7-2454738.pdf?src-supplier=Digikey; ComponentLink5URL: https://datasheet.ciiva.com/7746/443971-7746247.pdf?src-supplier=Element14; ComponentLink5Description: https://datasheet.ciiva.com/7746/443971-7746247.pdf?src-supplier=Element14; ComponentLink6URL: https://datasheet.ciiva.com/7746/443971-7746246.pdf?src-supplier=Element14; ComponentLink6Description: https://datasheet.ciiva.com/7746/443971-7746246.pdf?src-supplier=Element14